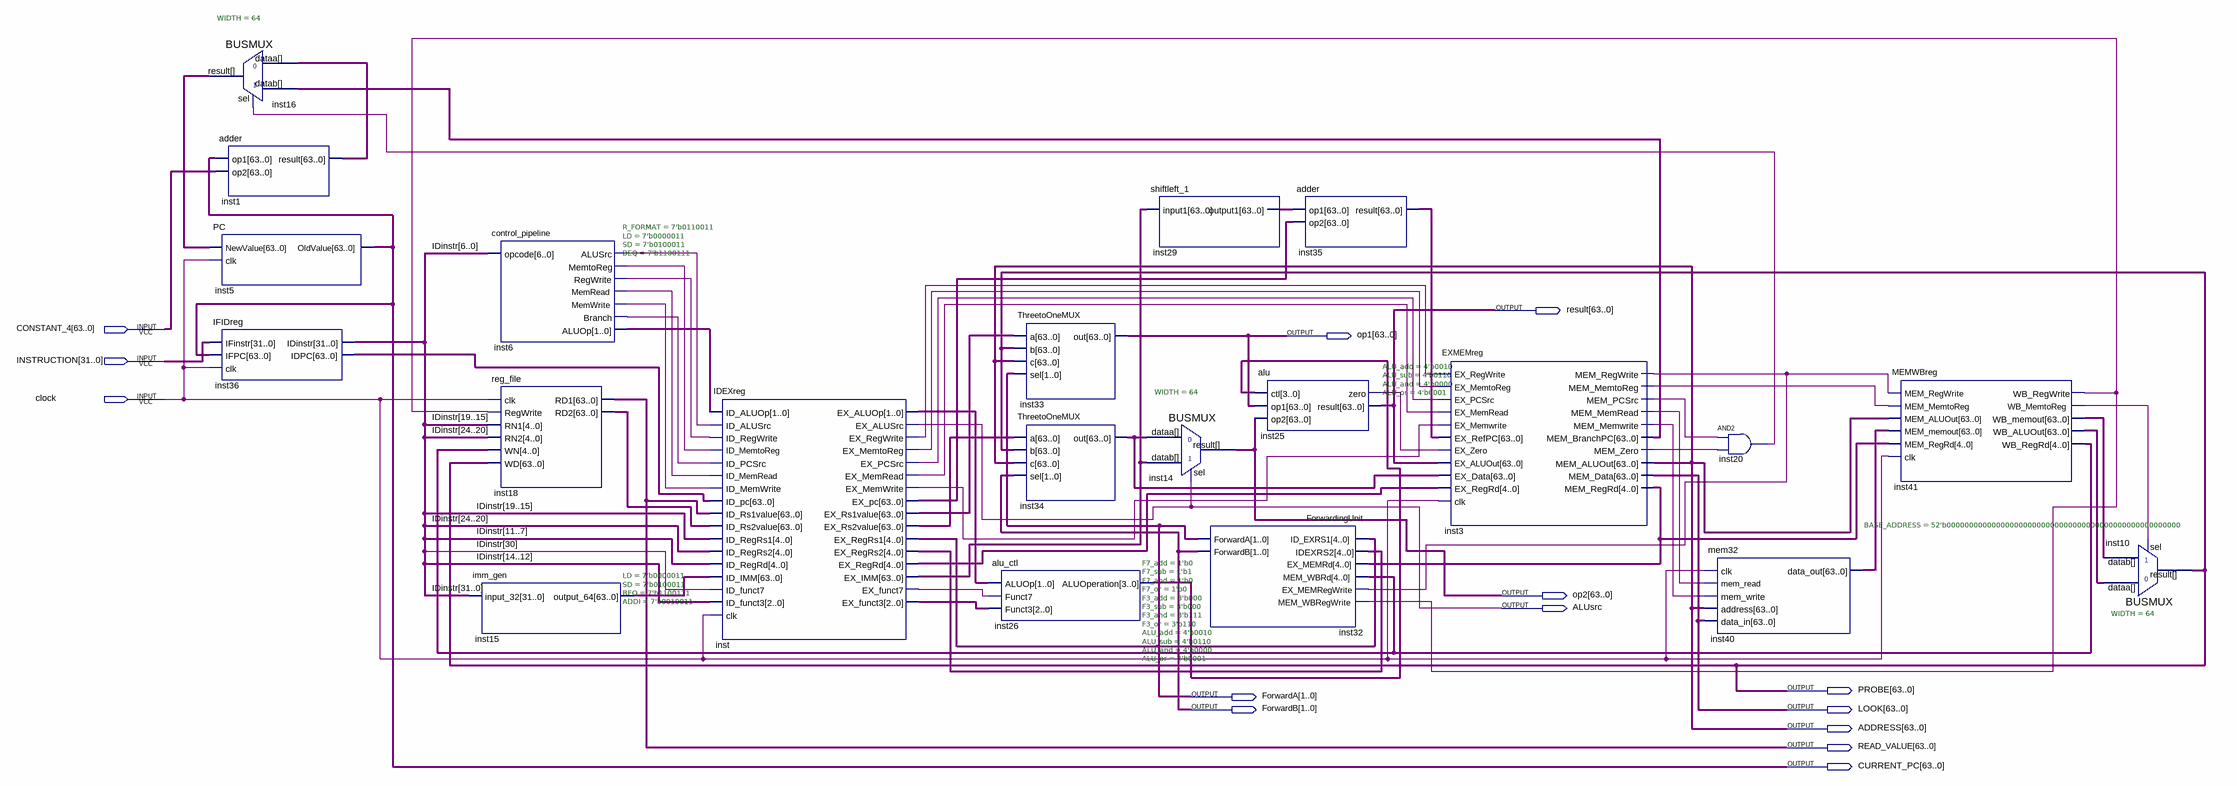
[diagram p0: schematic sheet]
// Quartus schematic top_level_LHJ.bdf as structural Verilog: 21 symbols, 14 pins
module top_level_LHJ (
  input  [63:0] CONSTANT_4,
  input  [31:0] INSTRUCTION,
  input  clock,
  output [63:0] result,
  output [63:0] op1,
  output [63:0] op2,
  output ALUsrc,
  output [63:0] PROBE,
  output [1:0] ForwardA,
  output [1:0] ForwardB,
  output [63:0] LOOK,
  output [63:0] ADDRESS,
  output [63:0] READ_VALUE,
  output [63:0] CURRENT_PC
);

  wire inst3_mem_memread, inst3_mem_memtoreg, inst3_mem_memwrite, inst3_mem_pcsrc, inst3_mem_regwrite,
       inst3_mem_zero, inst6_alusrc, inst6_branch, inst6_memread, inst6_memtoreg, inst6_memwrite,
       inst6_regwrite, inst20_out, inst25_zero, inst41_wb_memtoreg, inst41_wb_regwrite, inst_ex_funct7,
       inst_ex_memread, inst_ex_memtoreg, inst_ex_memwrite, inst_ex_pcsrc, inst_ex_regwrite;
  wire [1:0] inst6_aluop, inst_ex_aluop;
  wire [2:0] inst_ex_funct3;
  wire [3:0] inst26_aluoperation;
  wire [4:0] inst3_mem_regrd, inst41_wb_regrd, inst_ex_regrd, inst_ex_regrs1, inst_ex_regrs2;
  wire [31:0] IDinstr;
  wire [63:0] inst1_result, inst3_mem_branchpc, inst15_output_64, inst16_result, inst18_rd2, inst29_output1,
       inst34_out, inst35_result, inst36_idpc, inst40_data_out, inst41_wb_aluout, inst41_wb_memout,
       inst_ex_imm, inst_ex_pc, inst_ex_rs1value, inst_ex_rs2value;

  BUSMUX #(.WIDTH(64)) inst16 (
    .datab(inst3_mem_branchpc), .sel(inst20_out), .dataa(inst1_result), .result(inst16_result));
  adder inst1 (.op1(CURRENT_PC), .op2(CONSTANT_4), .result(inst1_result));
  PC inst5 (.NewValue(inst16_result), .clk(clock), .OldValue(CURRENT_PC));
  IFIDreg inst36 (.IFinstr(INSTRUCTION), .IFPC(CURRENT_PC), .clk(clock), .IDinstr(IDinstr), .IDPC(inst36_idpc));
  control_pipeline #(.R_FORMAT(7'b0110011), .LD(7'b0000011), .SD(7'b0100011), .BEQ(7'b1100111)) inst6 (
    .opcode(IDinstr[6:0]), .ALUSrc(inst6_alusrc), .MemtoReg(inst6_memtoreg), .RegWrite(inst6_regwrite),
    .MemRead(inst6_memread), .MemWrite(inst6_memwrite), .Branch(inst6_branch), .ALUOp(inst6_aluop));
  reg_file inst18 (
    .clk(clock), .RegWrite(inst41_wb_regwrite), .RN1(IDinstr[19:15]), .RN2(IDinstr[24:20]),
    .WN(inst41_wb_regrd), .WD(PROBE), .RD1(READ_VALUE), .RD2(inst18_rd2));
  imm_gen #(.LD(7'b0000011), .SD(7'b0100011), .BEQ(7'b1100111), .ADDI(7'b0010011)) inst15 (
    .input_32(IDinstr), .output_64(inst15_output_64));
  IDEXreg inst (
    .ID_ALUOp(inst6_aluop), .ID_ALUSrc(inst6_alusrc), .ID_RegWrite(inst6_regwrite),
    .ID_MemtoReg(inst6_memtoreg), .ID_PCSrc(inst6_branch), .ID_MemRead(inst6_memread),
    .ID_MemWrite(inst6_memwrite), .ID_pc(inst36_idpc), .ID_Rs1value(READ_VALUE), .ID_Rs2value(inst18_rd2),
    .ID_RegRs1(IDinstr[19:15]), .ID_RegRs2(IDinstr[24:20]), .ID_RegRd(IDinstr[11:7]),
    .ID_IMM(inst15_output_64), .ID_funct7(IDinstr[30]), .ID_funct3(IDinstr[14:12]), .clk(clock),
    .EX_ALUOp(inst_ex_aluop), .EX_ALUSrc(ALUsrc), .EX_RegWrite(inst_ex_regwrite),
    .EX_MemtoReg(inst_ex_memtoreg), .EX_PCSrc(inst_ex_pcsrc), .EX_MemRead(inst_ex_memread),
    .EX_MemWrite(inst_ex_memwrite), .EX_pc(inst_ex_pc), .EX_Rs1value(inst_ex_rs1value),
    .EX_Rs2value(inst_ex_rs2value), .EX_RegRs1(inst_ex_regrs1), .EX_RegRs2(inst_ex_regrs2),
    .EX_RegRd(inst_ex_regrd), .EX_IMM(inst_ex_imm), .EX_funct7(inst_ex_funct7), .EX_funct3(inst_ex_funct3));
  alu_ctl #(.F7_add(1'b0), .F7_sub(1'b1), .F7_and(1'b0), .F7_or(1'b0), .F3_add(3'b000), .F3_sub(3'b000), .F3_and(3'b111), .F3_or(3'b110), .ALU_add(4'b0010), .ALU_sub(4'b0110), .ALU_and(4'b0000), .ALU_or(4'b0001)) inst26 (
    .ALUOp(inst_ex_aluop), .Funct7(inst_ex_funct7), .Funct3(inst_ex_funct3),
    .ALUOperation(inst26_aluoperation));
  ThreetoOneMUX inst33 (.a(inst_ex_rs1value), .b(PROBE), .c(ADDRESS), .sel(ForwardA), .out(op1));
  ThreetoOneMUX inst34 (.a(inst_ex_rs2value), .b(PROBE), .c(ADDRESS), .sel(ForwardB), .out(inst34_out));
  shiftleft_1 inst29 (.input1(inst_ex_imm), .output1(inst29_output1));
  BUSMUX #(.WIDTH(64)) inst14 (.datab(inst_ex_imm), .sel(ALUsrc), .dataa(inst34_out), .result(op2));
  ForwardingUnit inst32 (
    .ID_EXRS1(inst_ex_regrs1), .IDEXRS2(inst_ex_regrs2), .EX_MEMRd(inst3_mem_regrd),
    .MEM_WBRd(inst41_wb_regrd), .EX_MEMRegWrite(inst3_mem_regwrite), .MEM_WBRegWrite(inst41_wb_regwrite),
    .ForwardA(ForwardA), .ForwardB(ForwardB));
  adder inst35 (.op1(inst29_output1), .op2(inst_ex_pc), .result(inst35_result));
  alu #(.ALU_add(4'b0010), .ALU_sub(4'b0110), .ALU_and(4'b0000), .ALU_or(4'b0001)) inst25 (
    .ctl(inst26_aluoperation), .op1(op1), .op2(op2), .zero(inst25_zero), .result(result));
  EXMEMreg inst3 (
    .EX_RegWrite(inst_ex_regwrite), .EX_MemtoReg(inst_ex_memtoreg), .EX_PCSrc(inst_ex_pcsrc),
    .EX_MemRead(inst_ex_memread), .EX_Memwrite(inst_ex_memwrite), .EX_RefPC(inst35_result),
    .EX_Zero(inst25_zero), .EX_ALUOut(result), .EX_Data(inst34_out), .EX_RegRd(inst_ex_regrd), .clk(clock),
    .MEM_RegWrite(inst3_mem_regwrite), .MEM_MemtoReg(inst3_mem_memtoreg), .MEM_PCSrc(inst3_mem_pcsrc),
    .MEM_MemRead(inst3_mem_memread), .MEM_Memwrite(inst3_mem_memwrite), .MEM_BranchPC(inst3_mem_branchpc),
    .MEM_Zero(inst3_mem_zero), .MEM_ALUOut(ADDRESS), .MEM_Data(LOOK), .MEM_RegRd(inst3_mem_regrd));
  mem32 #(.BASE_ADDRESS(52'b0000000000000000000000000000000000000000000000000000)) inst40 (
    .clk(clock), .mem_read(inst3_mem_memread), .mem_write(inst3_mem_memwrite), .address(ADDRESS),
    .data_in(LOOK), .data_out(inst40_data_out));
  and inst20 (inst20_out, inst3_mem_pcsrc, inst3_mem_zero);
  MEMWBreg inst41 (
    .MEM_RegWrite(inst3_mem_regwrite), .MEM_MemtoReg(inst3_mem_memtoreg), .MEM_ALUOut(ADDRESS),
    .MEM_memout(inst40_data_out), .MEM_RegRd(inst3_mem_regrd), .clk(clock), .WB_RegWrite(inst41_wb_regwrite),
    .WB_MemtoReg(inst41_wb_memtoreg), .WB_memout(inst41_wb_memout), .WB_ALUOut(inst41_wb_aluout),
    .WB_RegRd(inst41_wb_regrd));
  BUSMUX #(.WIDTH(64)) inst10 (
    .datab(inst41_wb_memout), .sel(inst41_wb_memtoreg), .dataa(inst41_wb_aluout), .result(PROBE));
endmodule
